# Altium project PCB_Project.PrjPcb (part 4 of 4)

## Sheet Shunt.SchDoc
size A4; SheetNumber: 5; SheetTotal: 5
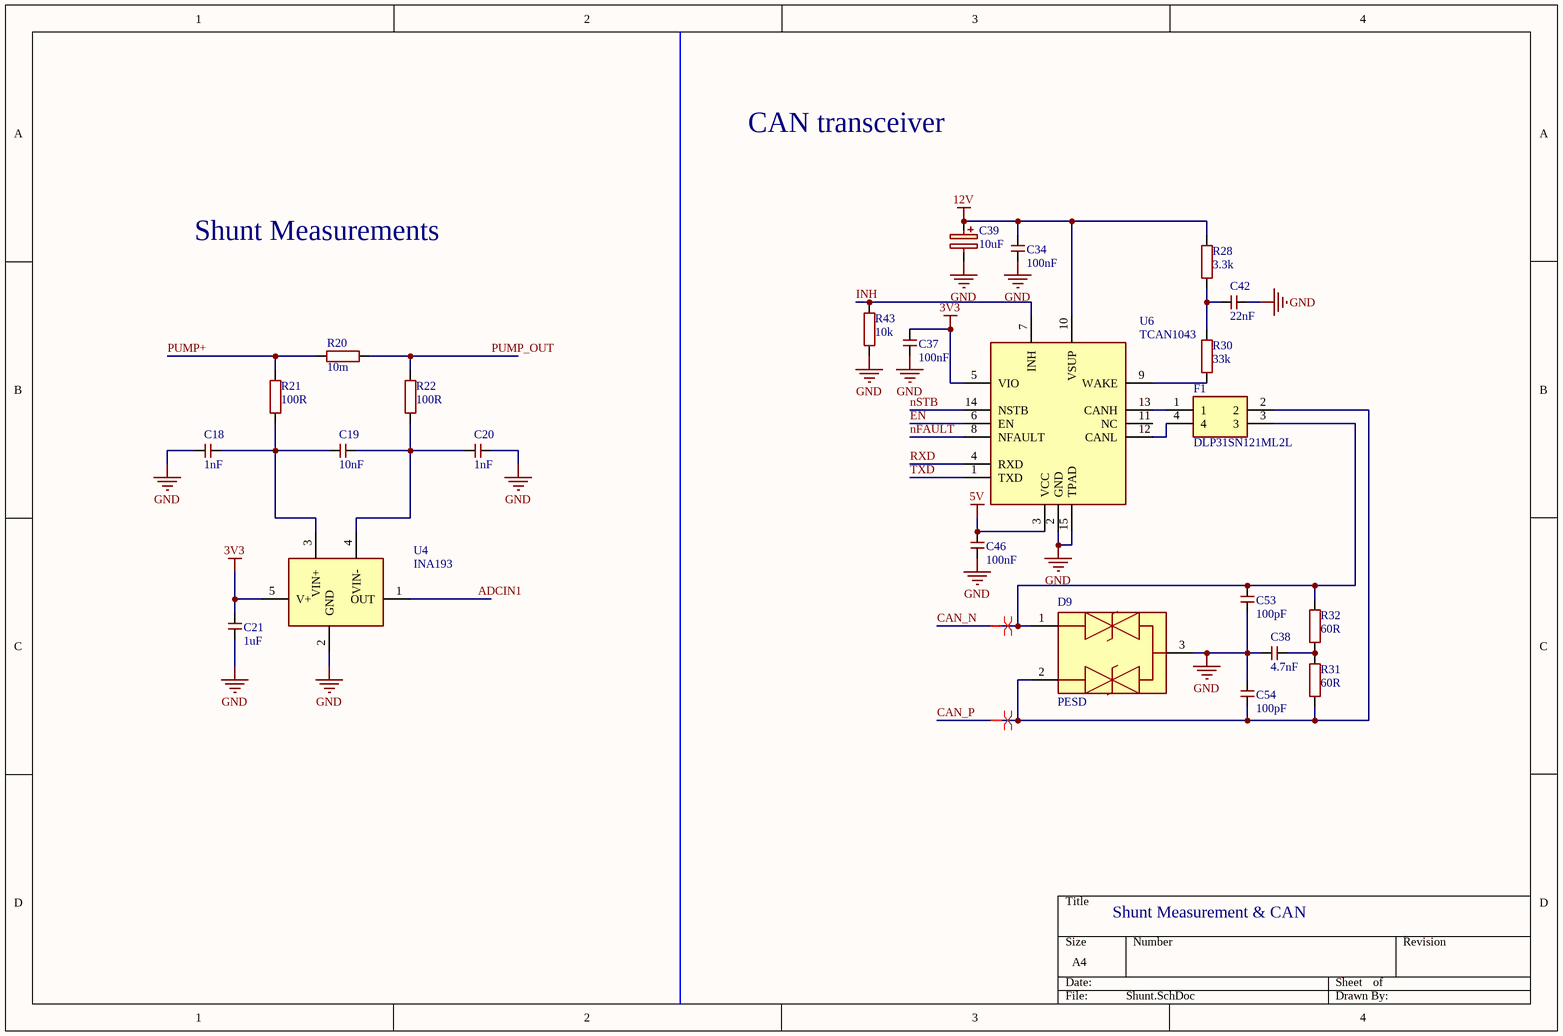
[diagram p4: Shunt.SchDoc]

### Parts
C18  1nF  [C0402]
C19  10nF  [C0402]
C20  1nF  [C0402]
C21  1uF  [C0402]
C34  100nF  [C0402]
C37  100nF  [C0402]
C38  4.7nF  [C0402]
C39  10uF  [CAPAE660X565N]
C42  22nF  [C0402]
C46  100nF  [C0402]
C53  100pF  [C0402]
C54  100pF  [C0402]
D9  PESD  [PESD2CANFD36LTQR]
F1  DLP31SN121ML2L  [DLP31SN121ML2B]
R20  10m  [CSS0402FT10L0]
R21  100R  [R0402]
R22  100R  [R0402]
R28  3.3k  [R0402]
R30  33k  [R0402]
R31  60R  [R0201]
R32  60R  [R0201]
R43  10k  [R0402]
U4  INA193  [SOT95P280X145-5N]
U6  TCAN1043  [SON65P300X450X90-15N]

### Nets
3V3: C21.2 C37.2 U4.5(V+) U6.5(VIO)
5V: C46.2 U6.3(VCC)
12V: C34.2 C39.1(+) R28.2 U6.10(VSUP)
GND: C18.1 C20.2 C21.1 C34.1 C37.1 C38.2 C39.2 C42.1 C46.1 C53.2 C54.1 D9.3(CC) R43.1 U4.2(GND) U6.2(GND) U6.15(TPAD)
ADCIN1: U4.1(OUT)
CAN_N: C53.1 D9.1(K1) F1.3 R32.1
CAN_P: C54.2 D9.2(K2) F1.2 R31.2
EN: U6.6(EN)
INH: R43.2 U6.7(INH)
nFAULT: U6.8(NFAULT)
nSTB: U6.14(NSTB)
PUMP+: R20.1 R21.2
PUMP_OUT: R20.2 R22.2
RXD: U6.4(RXD)
TXD: U6.1(TXD)
NetC18_2: C18.2 C19.1 R21.1 U4.3(VIN+)
NetC19_2: C19.2 C20.1 R22.1 U4.4(VIN-)
NetC38_1: C38.1 R31.1 R32.2
NetC42_2: C42.2 R28.1 R30.2
NetF1_1: F1.1 U6.13(CANH)
NetF1_4: F1.4 U6.12(CANL)
NetR30_1: R30.1 U6.9(WAKE)

Not connected (* = marked no-connect by the designer): U6 11(NC)

### Layout directives
differential pair: CAN_N, CAN_P

### Notes on the sheet
- CAN transceiver
- Shunt Measurements
- Shunt Measurement & CAN

### Library data of the parts
C18 C20 = C0402C102J5GACAUTO: Ceramic Capacitor, Multilayer, Ceramic, 50V, 5% +Tol, 5% -Tol, C0G, 30ppm/Cel TC, 0.001uF, Surface Mount, 0402; Manufacturer: KEMET; Multilayer: Yes; Reference Standard: AEC-Q200; Supplier: Mouser; Supplier Part Number: 80-C0402C102J5GAUTO; Manufacturer Part Number: C0402C102J5GACAUTO; RoHS: Yes; Category: Ceramic Capacitors; Stock: 231451; Pricing: 1=0.12, 10=0.048, 50=0.048, 100=0.032, 1000=0.024, 10000=0.019 (USD); Mounting Technology: Surface Mount; Pins: 2; Terminal Finish: Nickel; Dielectric Material: Ceramic; Case/Package: 0402; Min Operating Temperature: -55°C; Max Operating Temperature: 125°C; JESD-609 Code: e3; Capacitor Type: Ceramic; Package Style: SMTMeter; Value: 1nF; Tolerance  (fill in as +-): 5%; Packaging: Tape and Reel; Tolerance (fill in as +-): 5%; Rated DC Voltage (URdc): 50V; Temperature Characteristics Code: C0G; Length: 1mm; Width: 0.5mm; Height: 0.5mm; Reach SVHC Compliant: Yes; RoHS Compliant: Yes; ComponentLink1URL: https://datasheet.ciiva.com:443/pdfs/VipMasterIC/IC/KEME/KEME-S-A0008958445/KEME-S-A0008958445-1.pdf?src-supplier=IHS+Markit; ComponentLink1Description: https://datasheet.ciiva.com:443/pdfs/VipMasterIC/IC/KEME/KEME-S-A0008958445/KEME-S-A0008958445-1.pdf?src-supplier=IHS+Markit; ComponentLink2URL: http://www.farnell.com/datasheets/2750482.pdf?src-supplier=Farnell; ComponentLink2Description: http://www.farnell.com/datasheets/2750482.pdf?src-supplier=Farnell; ComponentLink3URL: https://datasheet.octopart.com/C0402C102J5GACAUTO-KEMET-datasheet-169773461.pdf?src-supplier=Newark; ComponentLink3Description: https://datasheet.octopart.com/C0402C102J5GACAUTO-KEMET-datasheet-169773461.pdf?src-supplier=Newark; ComponentLink4URL: http://www.farnell.com/datasheets/2750482.pdf?src-supplier=Newark; ComponentLink4Description: http://www.farnell.com/datasheets/2750482.pdf?src-supplier=Newark; ComponentLink5URL: https://api.kemet.com/component-edge/download/datasheet/C0402C102J5GACAUTO.pdf?src-supplier=Digikey; ComponentLink5Description: https://api.kemet.com/component-edge/download/datasheet/C0402C102J5GACAUTO.pdf?src-supplier=Digikey; ComponentLink6URL: http://www.kemet.com/docfinder?Partnumber=C0402C102J5GACAUTO&src-supplier=Digikey; ComponentLink6Description: http://www.kemet.com/docfinder?Partnumber=C0402C102J5GACAUTO&src-supplier=Digikey; ComponentLink7URL: https://datasheet.octopart.com/C0402C102J5GACAUTO-KEMET-datasheet-130259044.pdf?src-supplier=TME; ComponentLink7Description: https://datasheet.octopart.com/C0402C102J5GACAUTO-KEMET-datasheet-130259044.pdf?src-supplier=TME
C19 = C0402T103K4RALTU: Ceramic Capacitor, Multilayer, Ceramic, 16V, 10% +Tol, 10% -Tol, X7R, 15% TC, 0.01uF, Surface Mount, 0402; Manufacturer: KEMET; Multilayer: Yes; Supplier: Mouser; Supplier Part Number: 80-C0402T103K4RALTU; Manufacturer Part Number: C0402T103K4RALTU; RoHS: No; Category: Ceramic Capacitors; Stock: 17779; Pricing: 1=0.58, 10=0.42, 50=0.42, 100=0.337, 1000=0.294, 10000=0.246 (USD); Mounting Technology: Surface Mount; Pins: 2; Dielectric Material: Ceramic; Package Shape: Rectangular; Case/Package: 0402; Terminal Finish: Nickel; Min Operating Temperature: -55°C; Max Operating Temperature: 125°C; JESD-609 Code: e0; Value: 10nF; Capacitor Type: Ceramic; Tolerance  (fill in as +-): 10%; Package Style: SMTMeter; Packaging: Tape and Reel; Tolerance (fill in as +-): 10%; Rated DC Voltage (URdc): 16V; Temperature Characteristics Code: X7R; Termination: Wraparound; Length: 1mm; Width: 0.5mm; Height: 0.5mm; RoHS Compliant: No; Reach SVHC Compliant: No; ComponentLink1URL: https://datasheet.ciiva.com:443/pdfs/VipMasterIC/IC/KEME/KEME-S-A0008487487/KEME-S-A0008487487-1.pdf?src-supplier=IHS+Markit; ComponentLink1Description: https://datasheet.ciiva.com:443/pdfs/VipMasterIC/IC/KEME/KEME-S-A0008487487/KEME-S-A0008487487-1.pdf?src-supplier=IHS+Markit; ComponentLink2URL: https://datasheet.ciiva.com/15379/kem-c1027-x7r-cots-smd-15379193.pdf?src-supplier=Mouser; ComponentLink2Description: https://datasheet.ciiva.com/15379/kem-c1027-x7r-cots-smd-15379193.pdf?src-supplier=Mouser; ComponentLink3URL: https://datasheet.ciiva.com/148/kem-c1027-x7r-cots-smd-148853.pdf?src-supplier=Digikey; ComponentLink3Description: https://datasheet.ciiva.com/148/kem-c1027-x7r-cots-smd-148853.pdf?src-supplier=Digikey; ComponentLink4URL: https://datasheet.ciiva.com/148/kem-c1027-x7r-cots-smd-148851.pdf?src-supplier=Digikey; ComponentLink4Description: https://datasheet.ciiva.com/148/kem-c1027-x7r-cots-smd-148851.pdf?src-supplier=Digikey; ComponentLink5URL: https://datasheet.ciiva.com/148/kem-c1027-x7r-cots-smd-148852.pdf?src-supplier=Digikey; ComponentLink5Description: https://datasheet.ciiva.com/148/kem-c1027-x7r-cots-smd-148852.pdf?src-supplier=Digikey
C21 = C0402C105K4PAC7411: Ceramic Capacitor, Multilayer, Ceramic, 16V, 10% +Tol, 10% -Tol, X5R, 15% TC, 1uF, Surface Mount, 0402; Manufacturer: KEMET; Multilayer: Yes; Supplier: Mouser; Supplier Part Number: 80-C0402C105K4P7411; Manufacturer Part Number: C0402C105K4PAC7411; RoHS: Yes; Category: Ceramic Capacitors; Stock: 78488; Pricing: 1=0.11, 10=0.061, 50=0.061, 100=0.037, 1000=0.024, 10000=0.019 (USD); Mounting Technology: Surface Mount; Pins: 2; Dielectric Material: Ceramic; Package Shape: Rectangular; Case/Package: 0402; Min Operating Temperature: -55°C; Max Operating Temperature: 85°C; Value: 1uF; Capacitor Type: Ceramic; Tolerance  (fill in as +-): 10%; Packaging: Tape and Reel; Tolerance (fill in as +-): 10%; Rated DC Voltage (URdc): 16V; Temperature Characteristics Code: X5R; Termination: Wraparound; Reach SVHC Compliant: Yes; RoHS Compliant: Yes; ComponentLink1URL: https://datasheet.ciiva.com:443/pdfs/VipMasterIC/IC/KEME/KEME-S-A0008991665/KEME-S-A0008991665-1.pdf?src-supplier=IHS+Markit; ComponentLink1Description: https://datasheet.ciiva.com:443/pdfs/VipMasterIC/IC/KEME/KEME-S-A0008991665/KEME-S-A0008991665-1.pdf?src-supplier=IHS+Markit; ComponentLink2URL: https://api.kemet.com/component-edge/download/datasheet/C0402C105K4PAC7411.pdf?src-supplier=Digikey; ComponentLink2Description: https://api.kemet.com/component-edge/download/datasheet/C0402C105K4PAC7411.pdf?src-supplier=Digikey; ComponentLink3URL: https://datasheet.octopart.com/C0402C105K4PAC7411-KEMET-datasheet-142027389.pdf?src-supplier=Farnell; ComponentLink3Description: https://datasheet.octopart.com/C0402C105K4PAC7411-KEMET-datasheet-142027389.pdf?src-supplier=Farnell
C34 C37 C46 = C0402C104K3PACTU: Ceramic Capacitor, Multilayer, Ceramic, 25V, 10% +Tol, 10% -Tol, X5R, 15% TC, 0.1uF, Surface Mount, 0402; Manufacturer: KEMET; Multilayer: Yes; Supplier: Mouser; Supplier Part Number: 80-C0402C104K3P; Manufacturer Part Number: C0402C104K3PACTU; RoHS: Yes; Category: Ceramic Capacitors; Stock: 262570; Pricing: 1=0.12, 10=0.056, 50=0.056, 100=0.036, 1000=0.026, 10000=0.017 (USD); Mounting Technology: Surface Mount; Pins: 2; Dielectric Material: Ceramic; Package Shape: Rectangular; Case/Package: 0402; Terminal Finish: Nickel; Min Operating Temperature: -55°C; Max Operating Temperature: 85°C; JESD-609 Code: e3; Value: 100nF; Capacitor Type: Ceramic; Tolerance  (fill in as +-): 10%; Packaging: Tape and Reel; Tolerance (fill in as +-): 10%; Rated DC Voltage (URdc): 25V; Temperature Characteristics Code: X5R; Termination: Wraparound; Reach SVHC Compliant: Yes; RoHS Compliant: Yes; ComponentLink1URL: https://datasheet.ciiva.com:443/pdfs/VipMasterIC/IC/KEME/KEME-S-A0008991665/KEME-S-A0008991665-1.pdf?src-supplier=IHS+Markit; ComponentLink1Description: https://datasheet.ciiva.com:443/pdfs/VipMasterIC/IC/KEME/KEME-S-A0008991665/KEME-S-A0008991665-1.pdf?src-supplier=IHS+Markit; ComponentLink2URL: http://www.farnell.com/datasheets/2748284.pdf?src-supplier=Farnell; ComponentLink2Description: http://www.farnell.com/datasheets/2748284.pdf?src-supplier=Farnell; ComponentLink3URL: http://www.farnell.com/datasheets/2748284.pdf?src-supplier=Newark; ComponentLink3Description: http://www.farnell.com/datasheets/2748284.pdf?src-supplier=Newark; ComponentLink4URL: https://datasheet.octopart.com/C0402C104K3PACTU-KEMET-datasheet-181956028.pdf?src-supplier=Element14; ComponentLink4Description: https://datasheet.octopart.com/C0402C104K3PACTU-KEMET-datasheet-181956028.pdf?src-supplier=Element14
C38 = C0402C472J4JACAUTO: Cap Ceramic 0.0047uF 16V U2J 5% Pad SMD 0402 125C T/R; Manufacturer: KEMET; Supplier: Mouser; Supplier Part Number: 80-C0402C472J4JAUTO; Manufacturer Part Number: C0402C472J4JACAUTO; RoHS: No; Category: Ceramic Capacitors; Stock: 12001; Pricing: 1=0.48, 10=0.311, 50=0.311, 100=0.216, 1000=0.162, 10000=0.112 (USD)
C39 = EXV106M050A9GAA: Aluminum Electrolytic Capacitor, Polarized, Aluminum (wet), 50V, 20% +Tol, 20% -Tol, 10uF, Surface Mount, 2626; Manufacturer: KEMET; Dielectric Material: Aluminium; ESR (Equivalent Series Resistance): 2.6R; Leakage Current: 5uA; Ripple Current: 98mA; Tan Delta: 0.12; Supplier: Mouser; Supplier Part Number: 80-EXV106M050A9GAA; Manufacturer Part Number: EXV106M050A9GAA; RoHS: Yes; Category: Aluminum Electrolytic Capacitors; Stock: 17264; Pricing: 1=0.48, 10=0.255, 50=0.255, 100=0.165, 1000=0.139, 10000=0.112 (USD); Mounting Technology: Surface Mount; Pins: 2; Package Shape: Cylindrical; Case/Package: 2626; Min Operating Temperature: -55°C; Max Operating Temperature: 105°C; Polarity: Polarized; Value: 10uF; Capacitor Type: Aluminium; Tolerance  (fill in as +-): 20%; Package Style: SMTMeter; Packaging: Tape and Reel; Tolerance (fill in as +-): 20%; Rated DC Voltage (URdc): 50V; Termination: Flat; Length: 7.8mm; Width: 6.6mm; Height: 5.4mm; Reach SVHC Compliant: Yes; RoHS Compliant: Yes; ComponentLink1URL: https://datasheet.ciiva.com:443/pdfs/VipMasterIC/IC/KEME/KEME-S-A0009591402/KEME-S-A0009591402-1.pdf?src-supplier=IHS+Markit; ComponentLink1Description: https://datasheet.ciiva.com:443/pdfs/VipMasterIC/IC/KEME/KEME-S-A0009591402/KEME-S-A0009591402-1.pdf?src-supplier=IHS+Markit; ComponentLink2URL: https://datasheet.ciiva.com/22698/1500293-22698078.pdf?src-supplier=Element14; ComponentLink2Description: https://datasheet.ciiva.com/22698/1500293-22698078.pdf?src-supplier=Element14
C42 = C0402C223J5RACTU: Ceramic Capacitor, Multilayer, Ceramic, 50V, 5% +Tol, 5% -Tol, X7R, 15% TC, 0.022uF, Surface Mount, 0402; Manufacturer: KEMET; Multilayer: Yes; Supplier: Mouser; Supplier Part Number: 80-C0402C223J5RACTU; Manufacturer Part Number: C0402C223J5RACTU; RoHS: Yes; Category: Ceramic Capacitors; Stock: 18324; Pricing: 1=0.3, 10=0.185, 50=0.185, 100=0.12, 1000=0.087, 10000=0.063 (USD); Mounting Technology: Surface Mount; Pins: 2; Dielectric Material: Ceramic; Package Shape: Rectangular; Case/Package: 0402; Terminal Finish: Nickel; Min Operating Temperature: -55°C; Max Operating Temperature: 125°C; JESD-609 Code: e3; Value: 22nF; Capacitor Type: Ceramic; Tolerance  (fill in as +-): 5%; Package Style: SMTMeter; Packaging: Tape and Reel; Tolerance (fill in as +-): 5%; Rated DC Voltage (URdc): 50V; Temperature Characteristics Code: X7R; Termination: Wraparound; Length: 1mm; Width: 0.5mm; Height: 0.5mm; Reach SVHC Compliant: Yes; RoHS Compliant: Yes; ComponentLink1URL: https://datasheet.ciiva.com:443/pdfs/VipMasterIC/IC/KEME/KEME-S-A0008991654/KEME-S-A0008991654-1.pdf?src-supplier=IHS+Markit; ComponentLink1Description: https://datasheet.ciiva.com:443/pdfs/VipMasterIC/IC/KEME/KEME-S-A0008991654/KEME-S-A0008991654-1.pdf?src-supplier=IHS+Markit; ComponentLink2URL: http://capacitoredge.kemet.com/capedge2/DataSheet?pn=C0402C223J5RAC7867&src-supplier=Avnet; ComponentLink2Description: http://capacitoredge.kemet.com/capedge2/DataSheet?pn=C0402C223J5RAC7867&src-supplier=Avnet
C53 C54 = C0402C101K3RACAUTO: Multilayer Ceramic Capacitors MLCC - SMD/SMT 25V 100pF X7R 0402 10% AEC-Q200; Manufacturer: KEMET; Supplier: Mouser; Supplier Part Number: 80-C0402C101K3RAUTO; Manufacturer Part Number: C0402C101K3RACAUTO; RoHS: No; Category: Ceramic Capacitors; Stock: 198813; Pricing: 1=0.1, 10=0.046, 50=0.046, 100=0.028, 1000=0.02, 10000=0.013 (USD)
D9 = PESD2CANFD36LT-QR: ESD Protection Diodes / TVS Diodes ESD protection for in-vehicle networks; Manufacturer: Nexperia; Supplier: Mouser; Supplier Part Number: 771-PESD2CANFD36LTQR; Manufacturer Part Number: PESD2CANFD36LT-QR; RoHS: No; Stock: 13324; Pricing: 1=0.31, 10=0.216, 50=0.216, 100=0.09, 1000=0.074, 10000=0.043 (USD)
F1 = DLP31SN121ML2L: Data Line Filter, 2 Function(s), 16V, 0.1A, 4 Pin(s); Manufacturer: Murata; DC Resistance-Max: 2R; Insulation Resistance-Min: 100MR; Channels: 2; Output Impedance: 120R; Current Rating: 100mA; Supplier: Mouser; Supplier Part Number: 81-DLP31SN121ML2L; Manufacturer Part Number: DLP31SN121ML2L; RoHS: Yes; Category: Common Mode Chokes; Stock: 3150; Pricing: 1=1.54, 10=1.27, 50=1.07, 100=1.05, 1000=0.985, 10000=0.771 (USD); Mounting Technology: Surface Mount; Terminal Finish: Silver; Min Operating Temperature: -40°C; Max Operating Temperature: 85°C; JESD-609 Code: e4; Filter Type: DATA LINE FILTER; Packaging: Tape and Reel; Voltage Rating: 16V; Length: 3.2mm; Width: 1.6mm; Height: 1.15mm; Reach SVHC Compliant: Yes; RoHS Compliant: Yes; ComponentLink1URL: https://datasheet.ciiva.com:443/pdfs/VipMasterIC/IC/MURE/MURE-S-A0008512825/MURE-S-A0008513091-1.pdf?src-supplier=IHS+Markit; ComponentLink1Description: https://datasheet.ciiva.com:443/pdfs/VipMasterIC/IC/MURE/MURE-S-A0008512825/MURE-S-A0008513091-1.pdf?src-supplier=IHS+Markit; ComponentLink2URL: https://datasheet.ciiva.com/11799/0900766b80f15482-11799553.pdf?src-supplier=Rs; ComponentLink2Description: https://datasheet.ciiva.com/11799/0900766b80f15482-11799553.pdf?src-supplier=Rs; ComponentLink3URL: https://datasheet.ciiva.com/25666/l0114s0129dlp31s-25666023.pdf?src-supplier=Future+Electronics; ComponentLink3Description: https://datasheet.ciiva.com/25666/l0114s0129dlp31s-25666023.pdf?src-supplier=Future+Electronics; ComponentLink4URL: https://datasheet.ciiva.com/6214/l0114s0129dlp31s-6214636.pdf?src-supplier=Digikey; ComponentLink4Description: https://datasheet.ciiva.com/6214/l0114s0129dlp31s-6214636.pdf?src-supplier=Digikey; ComponentLink5URL: https://datasheet.ciiva.com/6214/l0114s0129dlp31s-6214639.pdf?src-supplier=Digikey; ComponentLink5Description: https://datasheet.ciiva.com/6214/l0114s0129dlp31s-6214639.pdf?src-supplier=Digikey; ComponentLink6URL: https://datasheet.ciiva.com/3068/l0114s0129dlp31s-3068654.pdf?src-supplier=Avnet; ComponentLink6Description: https://datasheet.ciiva.com/3068/l0114s0129dlp31s-3068654.pdf?src-supplier=Avnet; ComponentLink7URL: https://datasheet.ciiva.com/4942/muratadl-plseries-202927-4942133.pdf?src-supplier=Mouser; ComponentLink7Description: https://datasheet.ciiva.com/4942/muratadl-plseries-202927-4942133.pdf?src-supplier=Mouser
R20 = CSS0402FT10L0: Fixed Resistor, Metal Alloy, 0.33W, 0.01ohm, 1% +/-Tol, 100ppm/Cel, Surface Mount, 0402; Manufacturer: Stackpole Electronics; Supplier: Mouser; Supplier Part Number: 708-CSS0402FT10L0; Manufacturer Part Number: CSS0402FT10L0; RoHS: Yes; Category: Chip SMD Resistors; Stock: 3752; Pricing: 1=0.44, 10=0.272, 50=0.225, 100=0.187, 1000=0.142, 10000=0.116 (USD)
R21 R22 = RP0402DRD07100RL: Res, 100R, 0.5%, 0.063W, Thin Film, 0402 Rohs Compliant: Yes; Manufacturer: Yageo; Supplier: Mouser; Supplier Part Number: 603-RP0402DRD07100RL; Manufacturer Part Number: RP0402DRD07100RL; RoHS: No; Category: Chip SMD Resistors; Stock: 9231; Pricing: 1=0.21, 10=0.156, 50=0.122, 100=0.11, 1000=0.073, 10000=0.049 (USD)
R28 = RC0402FR-7D3K3L: Fixed Resistor, Metal Glaze/thick Film, 0.0625W, 3300ohm, 50V, 1% +/-Tol, 100ppm/Cel, Surface Mount, 0402; Manufacturer: Yageo; Additional Feature: LASER TRIMMABLE; Power: 62.5mW; Rated Temperature: 70°C; Value: 3.3kR; Temperature Coefficient (ppm/Cel): 100; Package Height: 0.35mm; Package Length: 1mm; Package Width: 0.5mm; Supplier: Mouser; Supplier Part Number: 603-RC0402FR-7D3K3L; Manufacturer Part Number: RC0402FR-7D3K3L; RoHS: Yes; Category: Resistors; Stock: 400223; Pricing: 1=0.1, 10=0.01, 50=0.01, 100=0.007, 1000=0.006, 10000=0.003 (USD); Mounting Technology: Surface Mount; Pins: 2; Package Shape: Rectangular; Case/Package: 0402; Terminal Finish: Nickel; Min Operating Temperature: -55°C; Max Operating Temperature: 155°C; Tolerance: 1%; JESD-609 Code: e3; Resistor Type: FIXED RESISTOR; Construction: Chip; Packaging: Tape and Reel; Technology: METAL GLAZE/THICK FILM; Termination: Wraparound; Working Voltage: 50V; Reach SVHC Compliant: Yes; RoHS Compliant: Yes
R30 = RC0402FR-7D33KL: Fixed Resistor, Metal Glaze/thick Film, 0.0625W, 33000ohm, 50V, 1% +/-Tol, 100ppm/Cel, Surface Mount, 0402; Manufacturer: Yageo; Supplier: Mouser; Supplier Part Number: 603-RC0402FR-7D33KL; Manufacturer Part Number: RC0402FR-7D33KL; RoHS: Yes; Category: Resistors; Stock: 38172; Pricing: 1=0.1, 10=0.01, 50=0.01, 100=0.007, 1000=0.006, 10000=0.003 (USD)
R31 R32 = RK73H1HRTTCM60R4F: Fixed Resistor, Metal Glaze/thick Film, 0.05W, 60.4ohm, 25V, 1% +/-Tol, 300ppm/Cel, Surface Mount, 0201; Manufacturer: KOA Speer; Supplier: Mouser; Supplier Part Number: 660-RK73H1HRTTCM60R4; Manufacturer Part Number: RK73H1HRTTCM60R4F; RoHS: Yes; Category: LDO; Stock: 38859; Pricing: 1=0.16, 10=0.079, 50=0.079, 100=0.046, 1000=0.028, 10000=0.02 (USD); Reach SVHC Compliant: Yes; RoHS Compliant: Yes
R43 = RP0402BRD0710KL: Resistor, 10K, 0.1%, 0.063W, THIN FILM, 0402;; Manufacturer: Yageo; Supplier: Mouser; Supplier Part Number: 603-RP0402BRD0710KL; Manufacturer Part Number: RP0402BRD0710KL; RoHS: No; Category: Chip SMD Resistors; Stock: 21771; Pricing: 1=0.24, 10=0.171, 50=0.134, 100=0.12, 1000=0.092, 10000=0.074 (USD); ComponentLink1URL: https://datasheet.octopart.com/RP0402BRD0710KL-Yageo-datasheet-179178423.pdf?src-supplier=Newark; ComponentLink1Description: https://datasheet.octopart.com/RP0402BRD0710KL-Yageo-datasheet-179178423.pdf?src-supplier=Newark
U4 = INA193AQDBVRQ1: Operational Amplifier, 1 Func, PDSO5; Manufacturer: Texas Instruments; Package Body Material: Plastic; Adjustable Threshold: No; Throw Configuration: POWER SUPPLY SUPPORT CIRCUIT; Number of Channels: 1; Package Equivalence Code: TSOP5/6,.11,37; Power Supplies: 12V; Supply Current-Max (Isup): 1.25mA; Max Supply Voltage: 18V; Min Supply Voltage: 2.7V; Qualification Status: Not Qualified; Supplier: Mouser; Supplier Part Number: 595-INA193AQDBVRQ1; Manufacturer Part Number: INA193AQDBVRQ1; RoHS: Yes; Category: Amplifiers - Op Amps, Buffer, Instrumentation; Stock: 19974; Pricing: 1=4.07, 10=3.08, 50=2.83, 100=2.56, 1000=2.29, 10000=2.18 (USD); Case/Package: LSSOP; Pins: 5; Package Shape: Rectangular; Terminal Finish: Nickel; Min Operating Temperature: -40°C; Max Operating Temperature: 125°C; JESD-609 Code: e4; JESD-30 Code: R-PDSO-G5; Moisture Sensitivity Level: 2; Channels: 1; Package Style: SMALL OUTLINE, LOW PROFILE, SHRINK PITCHMeter; Peak Reflow Temperature (Cel): 260°C; Nominal Supply Voltage: 12V; Surface Mount: Yes; Terminal Form: Gull Wing; Terminal Position: DUAL; Length: 2.9mm; Width: 1.6mm; Height - Seated (Max): 1.45mm; Terminal Pitch: 0.95mm; Temperature Grade: AUTOMOTIVE; Reach SVHC Compliant: Yes; RoHS Compliant: Yes; ComponentLink1URL: https://www.ti.com:443/lit/ds/symlink/ina193a-q1.pdf?src-supplier=IHS+Markit; ComponentLink1Description: https://www.ti.com:443/lit/ds/symlink/ina193a-q1.pdf?src-supplier=IHS+Markit; ComponentLink2URL: https://datasheet.ciiva.com/1939/ina193a-q1-1939597.pdf?src-supplier=Digikey; ComponentLink2Description: https://datasheet.ciiva.com/1939/ina193a-q1-1939597.pdf?src-supplier=Digikey; ComponentLink3URL: https://datasheet.ciiva.com/1577/1383809-1577443.pdf?src-supplier=Newark; ComponentLink3Description: https://datasheet.ciiva.com/1577/1383809-1577443.pdf?src-supplier=Newark; ComponentLink4URL: https://datasheet.ciiva.com/4875/sbos366c-126160-4875330.pdf?src-supplier=Mouser; ComponentLink4Description: https://datasheet.ciiva.com/4875/sbos366c-126160-4875330.pdf?src-supplier=Mouser; ComponentLink5URL: https://datasheet.ciiva.com/15134/getdatasheetpartid-255678-15134586.pdf?src-supplier=Verical; ComponentLink5Description: https://datasheet.ciiva.com/15134/getdatasheetpartid-255678-15134586.pdf?src-supplier=Verical; ComponentLink6URL: https://datasheet.ciiva.com/2977/ina198a-q1-2977933.pdf?src-supplier=Avnet; ComponentLink6Description: https://datasheet.ciiva.com/2977/ina198a-q1-2977933.pdf?src-supplier=Avnet; ComponentLink7URL: https://datasheet.ciiva.com/2977/ina198a-q1-2977934.pdf?src-supplier=Avnet; ComponentLink7Description: https://datasheet.ciiva.com/2977/ina198a-q1-2977934.pdf?src-supplier=Avnet
U6 = TCAN1043DMTRQ1: Ethernet Transceiver, 1-Trnsvr, PDSO14; Manufacturer: Texas Instruments; Supplier: Mouser; Supplier Part Number: 595-TCAN1043DMTRQ1; Manufacturer Part Number: TCAN1043DMTRQ1; RoHS: Yes; Category: Interface ICs; Stock: 28707; Pricing: 1=2.47, 10=1.84, 50=1.68, 100=1.51, 1000=1.33, 10000=1.16 (USD); Terminal Finish: Tin; JESD-609 Code: e3; Moisture Sensitivity Level: 2; Telecom IC Type: ETHERNET TRANSCEIVER; Reach SVHC Compliant: Yes; RoHS Compliant: Yes; ComponentLink1URL: https://www.ti.com:443/lit/ds/symlink/tcan1043-q1.pdf?src-supplier=IHS+Markit; ComponentLink1Description: https://www.ti.com:443/lit/ds/symlink/tcan1043-q1.pdf?src-supplier=IHS+Markit; ComponentLink2URL: http://www.ti.com/lit/ds/symlink/tcan1043-q1.pdf?src-supplier=Digikey; ComponentLink2Description: http://www.ti.com/lit/ds/symlink/tcan1043-q1.pdf?src-supplier=Digikey

## Sheet NTC.SchDoc
size A4; SheetNumber: 6; SheetTotal: 6
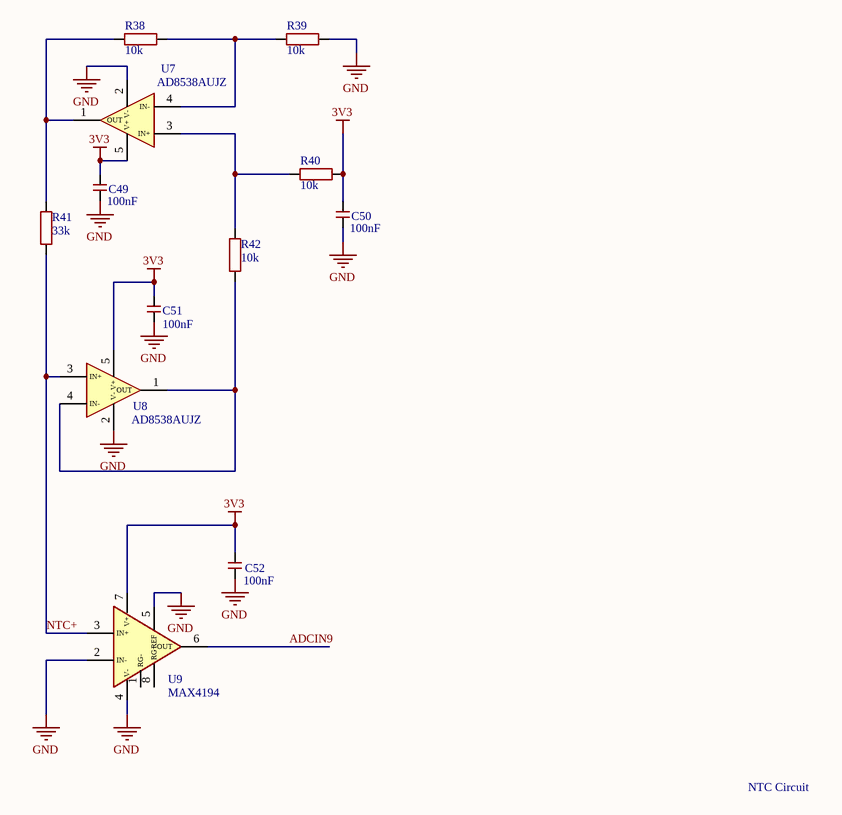
[diagram p5: NTC.SchDoc]

### Parts
C49  100nF  [C0402]
C50  100nF  [C0402]
C51  100nF  [C0402]
C52  100nF  [C0402]
R38  10k  [R0402]
R39  10k  [R0402]
R40  10k  [R0402]
R41  33k  [R0402]
R42  10k  [R0402]
U7  AD8538AUJZ  [SOT95P280X100-5N]
U8  AD8538AUJZ  [SOT95P280X100-5N]
U9  MAX4194  [SOIC127P600X175-8N]

### Nets
3V3: C49.2 C50.2 C51.2 C52.2 R40.2 U7.5(V+) U8.5(V+) U9.7(V+)
GND: C49.1 C50.1 C51.1 C52.1 R39.2 U7.2(V-) U8.2(V-) U9.2(IN-) U9.4(V-) U9.5(REF)
ADCIN9: U9.6(OUT)
NTC+: R41.1 U8.3(IN+) U9.3(IN+)
NetR38_1: R38.1 R41.2 U7.1(OUT)
NetR38_2: R38.2 R39.1 U7.4(IN-)
NetR40_1: R40.1 R42.2 U7.3(IN+)
NetR42_1: R42.1 U8.1(OUT) U8.4(IN-)

Not connected (* = marked no-connect by the designer): U9 1(RG-) 8(RG+)

### Notes on the sheet
- NTC Circuit

### Library data of the parts
C49-C52 = C0402C104K3PACTU: as C34 on sheet Shunt; Supplier: Mouser; Supplier Part Number: 80-C0402C104K3P; Manufacturer Part Number: C0402C104K3PACTU; RoHS: Yes; Category: Ceramic Capacitors; Stock: 262570; Pricing: 1=0.12, 10=0.056, 50=0.056, 100=0.036, 1000=0.026, 10000=0.017 (USD); Mounting Technology: Surface Mount; Pins: 2; Dielectric Material: Ceramic; Package Shape: Rectangular; Case/Package: 0402; Terminal Finish: Nickel; Min Operating Temperature: -55°C; Max Operating Temperature: 85°C; JESD-609 Code: e3; Value: 100nF; Capacitor Type: Ceramic; Tolerance  (fill in as +-): 10%; Packaging: Tape and Reel; Tolerance (fill in as +-): 10%; Rated DC Voltage (URdc): 25V; Temperature Characteristics Code: X5R; Termination: Wraparound; Reach SVHC Compliant: Yes; RoHS Compliant: Yes; ComponentLink1URL: https://datasheet.ciiva.com:443/pdfs/VipMasterIC/IC/KEME/KEME-S-A0008991665/KEME-S-A0008991665-1.pdf?src-supplier=IHS+Markit; ComponentLink1Description: https://datasheet.ciiva.com:443/pdfs/VipMasterIC/IC/KEME/KEME-S-A0008991665/KEME-S-A0008991665-1.pdf?src-supplier=IHS+Markit; ComponentLink2URL: http://www.farnell.com/datasheets/2748284.pdf?src-supplier=Farnell; ComponentLink2Description: http://www.farnell.com/datasheets/2748284.pdf?src-supplier=Farnell; ComponentLink3URL: http://www.farnell.com/datasheets/2748284.pdf?src-supplier=Newark; ComponentLink3Description: http://www.farnell.com/datasheets/2748284.pdf?src-supplier=Newark; ComponentLink4URL: https://datasheet.octopart.com/C0402C104K3PACTU-KEMET-datasheet-181956028.pdf?src-supplier=Element14; ComponentLink4Description: https://datasheet.octopart.com/C0402C104K3PACTU-KEMET-datasheet-181956028.pdf?src-supplier=Element14
R38-R40 R42 = RP0402BRD0710KL: as R43 on sheet Shunt; Supplier: Mouser; Supplier Part Number: 603-RP0402BRD0710KL; Manufacturer Part Number: RP0402BRD0710KL; RoHS: No; Category: Chip SMD Resistors; Stock: 21771; Pricing: 1=0.24, 10=0.171, 50=0.134, 100=0.12, 1000=0.092, 10000=0.074 (USD); ComponentLink1URL: https://datasheet.octopart.com/RP0402BRD0710KL-Yageo-datasheet-179178423.pdf?src-supplier=Newark; ComponentLink1Description: https://datasheet.octopart.com/RP0402BRD0710KL-Yageo-datasheet-179178423.pdf?src-supplier=Newark
R41 = RC0402FR-7D33KL: as R30 on sheet Shunt; Supplier: Mouser; Supplier Part Number: 603-RC0402FR-7D33KL; Manufacturer Part Number: RC0402FR-7D33KL; RoHS: Yes; Category: Resistors; Stock: 38172; Pricing: 1=0.1, 10=0.01, 50=0.01, 100=0.007, 1000=0.006, 10000=0.003 (USD)
U7 U8 = AD8538AUJZ-REEL7: Operational Amplifier, 1 Func, 30uV Offset-Max, CMOS, PDSO5; Manufacturer: Analog Devices; Package Body Material: Plastic; Architecture: VOLTAGE-FEEDBACK; Average Bias Current-Max (IIB): 100pA; Bias Current-Max (IIB) @25C: 25pA; Common-mode Reject Ratio-Nom: 135dB; Frequency Compensation: YES; Neg Supply Voltage Limit-Max: 0V; Channels: 1; Package Equivalence Code: TSOP5/6,.11,37; Power: No; Power Supplies: +-1.35/+-2.5/2.7/5V; Slew Rate: 0.4V/µs; Max Supply Current: 215uA; Supply Voltage Limit-Max: 6V; Nominal Supply Voltage: 5V; Time @ Peak Reflow Temperature-Max (s): 40s; Unity Gain BW-Nom: 430kHz; Voltage Gain-Min: 178000; Qualification Status: Not Qualified; Supplier: Mouser; Supplier Part Number: 584-AD8538AUJZ-R7; Manufacturer Part Number: AD8538AUJZ-REEL7; RoHS: Yes; Category: Amplifiers - Op Amps, Buffer, Instrumentation; Stock: 130448; Pricing: 1=1.65, 10=1.42, 50=1.42, 100=1.25, 1000=0.916, 10000=0.84 (USD); Case/Package: VSSOP; Pins: 5; Package Shape: Rectangular; Terminal Finish: Tin; Min Operating Temperature: -40°C; Max Operating Temperature: 125°C; JESD-609 Code: e3; Amplifier Type: OPERATIONAL AMPLIFIER; Input Offset Voltage-Max: 30uV; JESD-30 Code: R-PDSO-G5; Low-Bias: Yes; Low-Offset: Yes; Micropower: Yes; Moisture Sensitivity Level: 1; Neg Supply Voltage-Nom (Vsup): 0V; Package Style: SMALL OUTLINE, VERY THIN PROFILE, SHRINK PITCHMeter; Packaging: Tape and Reel; Peak Reflow Temperature (Cel): 260°C; Programmable Power: No; Surface Mount: Yes; Technology: CMOS; Terminal Form: Gull Wing; Terminal Position: DUAL; Wideband: No; Length: 2.9mm; Width: 1.6mm; Height - Seated (Max): 1mm; Terminal Pitch: 0.95mm; Temperature Grade: AUTOMOTIVE; Reach SVHC Compliant: Yes; RoHS Compliant: Yes; ComponentLink1URL: https://datasheet.ciiva.com:443/pdfs/VipMasterIC/IC/ANDI/ANDIS13894/ANDIS13894-1.pdf?src-supplier=IHS+Markit; ComponentLink1Description: https://datasheet.ciiva.com:443/pdfs/VipMasterIC/IC/ANDI/ANDIS13894/ANDIS13894-1.pdf?src-supplier=IHS+Markit; ComponentLink2URL: https://datasheet.ciiva.com/15374/ad8538-8539-243268-15374656.pdf?src-supplier=Mouser; ComponentLink2Description: https://datasheet.ciiva.com/15374/ad8538-8539-243268-15374656.pdf?src-supplier=Mouser; ComponentLink3URL: https://datasheet.ciiva.com/2974/ad8538-8539-2974672.pdf?src-supplier=Avnet; ComponentLink3Description: https://datasheet.ciiva.com/2974/ad8538-8539-2974672.pdf?src-supplier=Avnet; ComponentLink4URL: https://datasheet.ciiva.com/1793/ad8538-8539-1793940.pdf?src-supplier=Digikey; ComponentLink4Description: https://datasheet.ciiva.com/1793/ad8538-8539-1793940.pdf?src-supplier=Digikey; ComponentLink5URL: https://datasheet.ciiva.com/1793/ad8538-8539-1793941.pdf?src-supplier=Digikey; ComponentLink5Description: https://datasheet.ciiva.com/1793/ad8538-8539-1793941.pdf?src-supplier=Digikey; ComponentLink6URL: https://datasheet.ciiva.com/1793/ad8538-8539-1793942.pdf?src-supplier=Digikey; ComponentLink6Description: https://datasheet.ciiva.com/1793/ad8538-8539-1793942.pdf?src-supplier=Digikey; ComponentLink7URL: https://datasheet.ciiva.com/2973/ad8538-8539-2973062.pdf?src-supplier=Avnet; ComponentLink7Description: https://datasheet.ciiva.com/2973/ad8538-8539-2973062.pdf?src-supplier=Avnet
U9 = MAX4194ESA+: Instrumentation Amplifier, 1 Func, 690uV Offset-Max, 0.25MHz Band Width, PDSO8; Manufacturer: Maxim; Package Body Material: Plastic; Average Bias Current-Max (IIB): 20nA; Bandwidth (3dB)-Nom: 250kHz; Common Mode Rejection Ratio-Min: 73dB; Input Offset Current-Max (IIO): 3nA; Channels: 1; Package Equivalence Code: SOP8,.25; Power Supplies: +-1.35/+-3.75/2.7/7.5V; Slew Rate: 0.06V/µs; Max Supply Current: 110uA; Supply Voltage Limit-Max: 8V; Nominal Supply Voltage: 5V; Time @ Peak Reflow Temperature-Max (s): 30s; Voltage Gain-Max: 10000; Qualification Status: Not Qualified; Supplier: Mouser; Supplier Part Number: 700-MAX4194ESA; Manufacturer Part Number: MAX4194ESA+; RoHS: Yes; Category: Amplifiers - Op Amps, Buffer, Instrumentation; Stock: 2146; Pricing: 1=7.06, 10=5.31, 50=5.17, 100=4.65, 1000=3.83, 10000=3.83 (USD); Case/Package: SOP; Pins: 8; Terminal Finish: Tin; Package Shape: Rectangular; Min Operating Temperature: -40°C; Max Operating Temperature: 85°C; Amplifier Type: INSTRUMENTATION AMPLIFIER; JESD-609 Code: e3; Moisture Sensitivity Level: 1; Input Offset Voltage-Max: 690uV; JESD-30 Code: R-PDSO-G8; Package Style: SMALL OUTLINEMeter; Peak Reflow Temperature (Cel): 260°C; Surface Mount: Yes; Terminal Form: Gull Wing; Terminal Position: DUAL; Voltage Gain-Min: 1; Length: 4.9mm; Width: 3.9mm; Height - Seated (Max): 1.75mm; Terminal Pitch: 1.27mm; Reach SVHC Compliant: Yes; RoHS Compliant: Yes; Temperature Grade: INDUSTRIAL; ComponentLink1URL: https://datasheet.ciiva.com:443/pdfs/VipMasterIC/IC/MAXM/MAXMS15090/MAXMS15090-1.pdf?src-supplier=IHS+Markit; ComponentLink1Description: https://datasheet.ciiva.com:443/pdfs/VipMasterIC/IC/MAXM/MAXMS15090/MAXMS15090-1.pdf?src-supplier=IHS+Markit; ComponentLink2URL: https://datasheet.ciiva.com/2975/max4194-max4197-2975858.pdf?src-supplier=Avnet; ComponentLink2Description: https://datasheet.ciiva.com/2975/max4194-max4197-2975858.pdf?src-supplier=Avnet; ComponentLink3URL: https://datasheet.ciiva.com/14338/max4194-max4197-14338475.pdf?src-supplier=Avnet; ComponentLink3Description: https://datasheet.ciiva.com/14338/max4194-max4197-14338475.pdf?src-supplier=Avnet; ComponentLink4URL: https://datasheet.ciiva.com/1802/max4194-max4197-1802609.pdf?src-supplier=Digikey; ComponentLink4Description: https://datasheet.ciiva.com/1802/max4194-max4197-1802609.pdf?src-supplier=Digikey; ComponentLink5URL: https://datasheet.ciiva.com/1819/max4194-max4197-1819822.pdf?src-supplier=Digikey; ComponentLink5Description: https://datasheet.ciiva.com/1819/max4194-max4197-1819822.pdf?src-supplier=Digikey

## Nets that join several sheets
3V3: Power Supply (R8.2), Microcontroller (17 pins), Shunt (C21.2 C37.2 U4.5 U6.5), NTC (8 pins)
5V: Power Supply (9 pins), Shunt (C46.2 U6.3)
12V: Input Stage (Q1.3), Power Supply (5 pins), Pump Driver (C16.2 U3.17), Shunt (C34.2 C39.1 R28.2 U6.10)
GND: Input Stage (14 pins), Power Supply (22 pins), Microcontroller (31 pins), Pump Driver (6 pins), Shunt (16 pins), NTC (10 pins)
ADCIN0: Microcontroller (U5.50), Pump Driver (C17.2 R17.1)
ADCIN1: Microcontroller (U5.49), Shunt (U4.1)
ADCIN9: Microcontroller (U5.48), NTC (U9.6)
CAN_N: Input Stage (J1.B1), Shunt (C53.1 D9.1 F1.3 R32.1)
CAN_P: Input Stage (J1.B2), Shunt (C54.2 D9.2 F1.2 R31.2)
EN: Microcontroller (U5.2), Shunt (U6.6)
~{FAULT}: Microcontroller (U5.8), Pump Driver (R11.1)
IN0: Microcontroller (U5.19), Pump Driver (R12.1)
IN1: Microcontroller (U5.22), Pump Driver (R13.1)
nFAULT: Microcontroller (U5.5), Shunt (U6.8)
nSTB: Microcontroller (U5.1), Shunt (U6.14)
NTC+: Input Stage (J1.A1), NTC (R41.1 U8.3 U9.3)
nTRST: Input Stage (J1.B8), Microcontroller (U5.76)
PUMP+: Pump Driver (5 pins), Shunt (R20.1 R21.2)
PUMP_OUT: Input Stage (J1.B3), Shunt (R20.2 R22.2)
RTCK: Input Stage (J1.B12), Microcontroller (U5.80)
RXD: Microcontroller (U5.63), Shunt (U6.4)
SEL0: Microcontroller (U5.9), Pump Driver (R15.1)
SEL1: Microcontroller (U5.10), Pump Driver (R16.1)
SEN: Microcontroller (U5.12), Pump Driver (R14.1)
TCK: Input Stage (J1.B11), Microcontroller (U5.79)
TDI: Input Stage (J1.B9), Microcontroller (U5.77)
TDO: Input Stage (J1.B10), Microcontroller (U5.78)
TMS: Input Stage (J1.B7), Microcontroller (U5.75)
TXD: Microcontroller (U5.62), Shunt (U6.1)